# Altium schematic sheet Main scheme.SchDoc
size 410 x 297 mm; ApprovedBy: Стерхов В.Д.; CheckedBy: Стерхов В.Д.; Author: Сергеев Д.А.; CompanyName: ГК "СНАБЖЕНИЕ"; DrawnBy: Сергеев Д.А.; Engineer: Сергеев Д.А.; Organization: ГК "СНАБЖЕНИЕ"; DocumentNumber: ИЛ1397ТО1/1; Revision: ИЛ1397ТО1/1; SheetNumber: 1; SheetTotal: 3
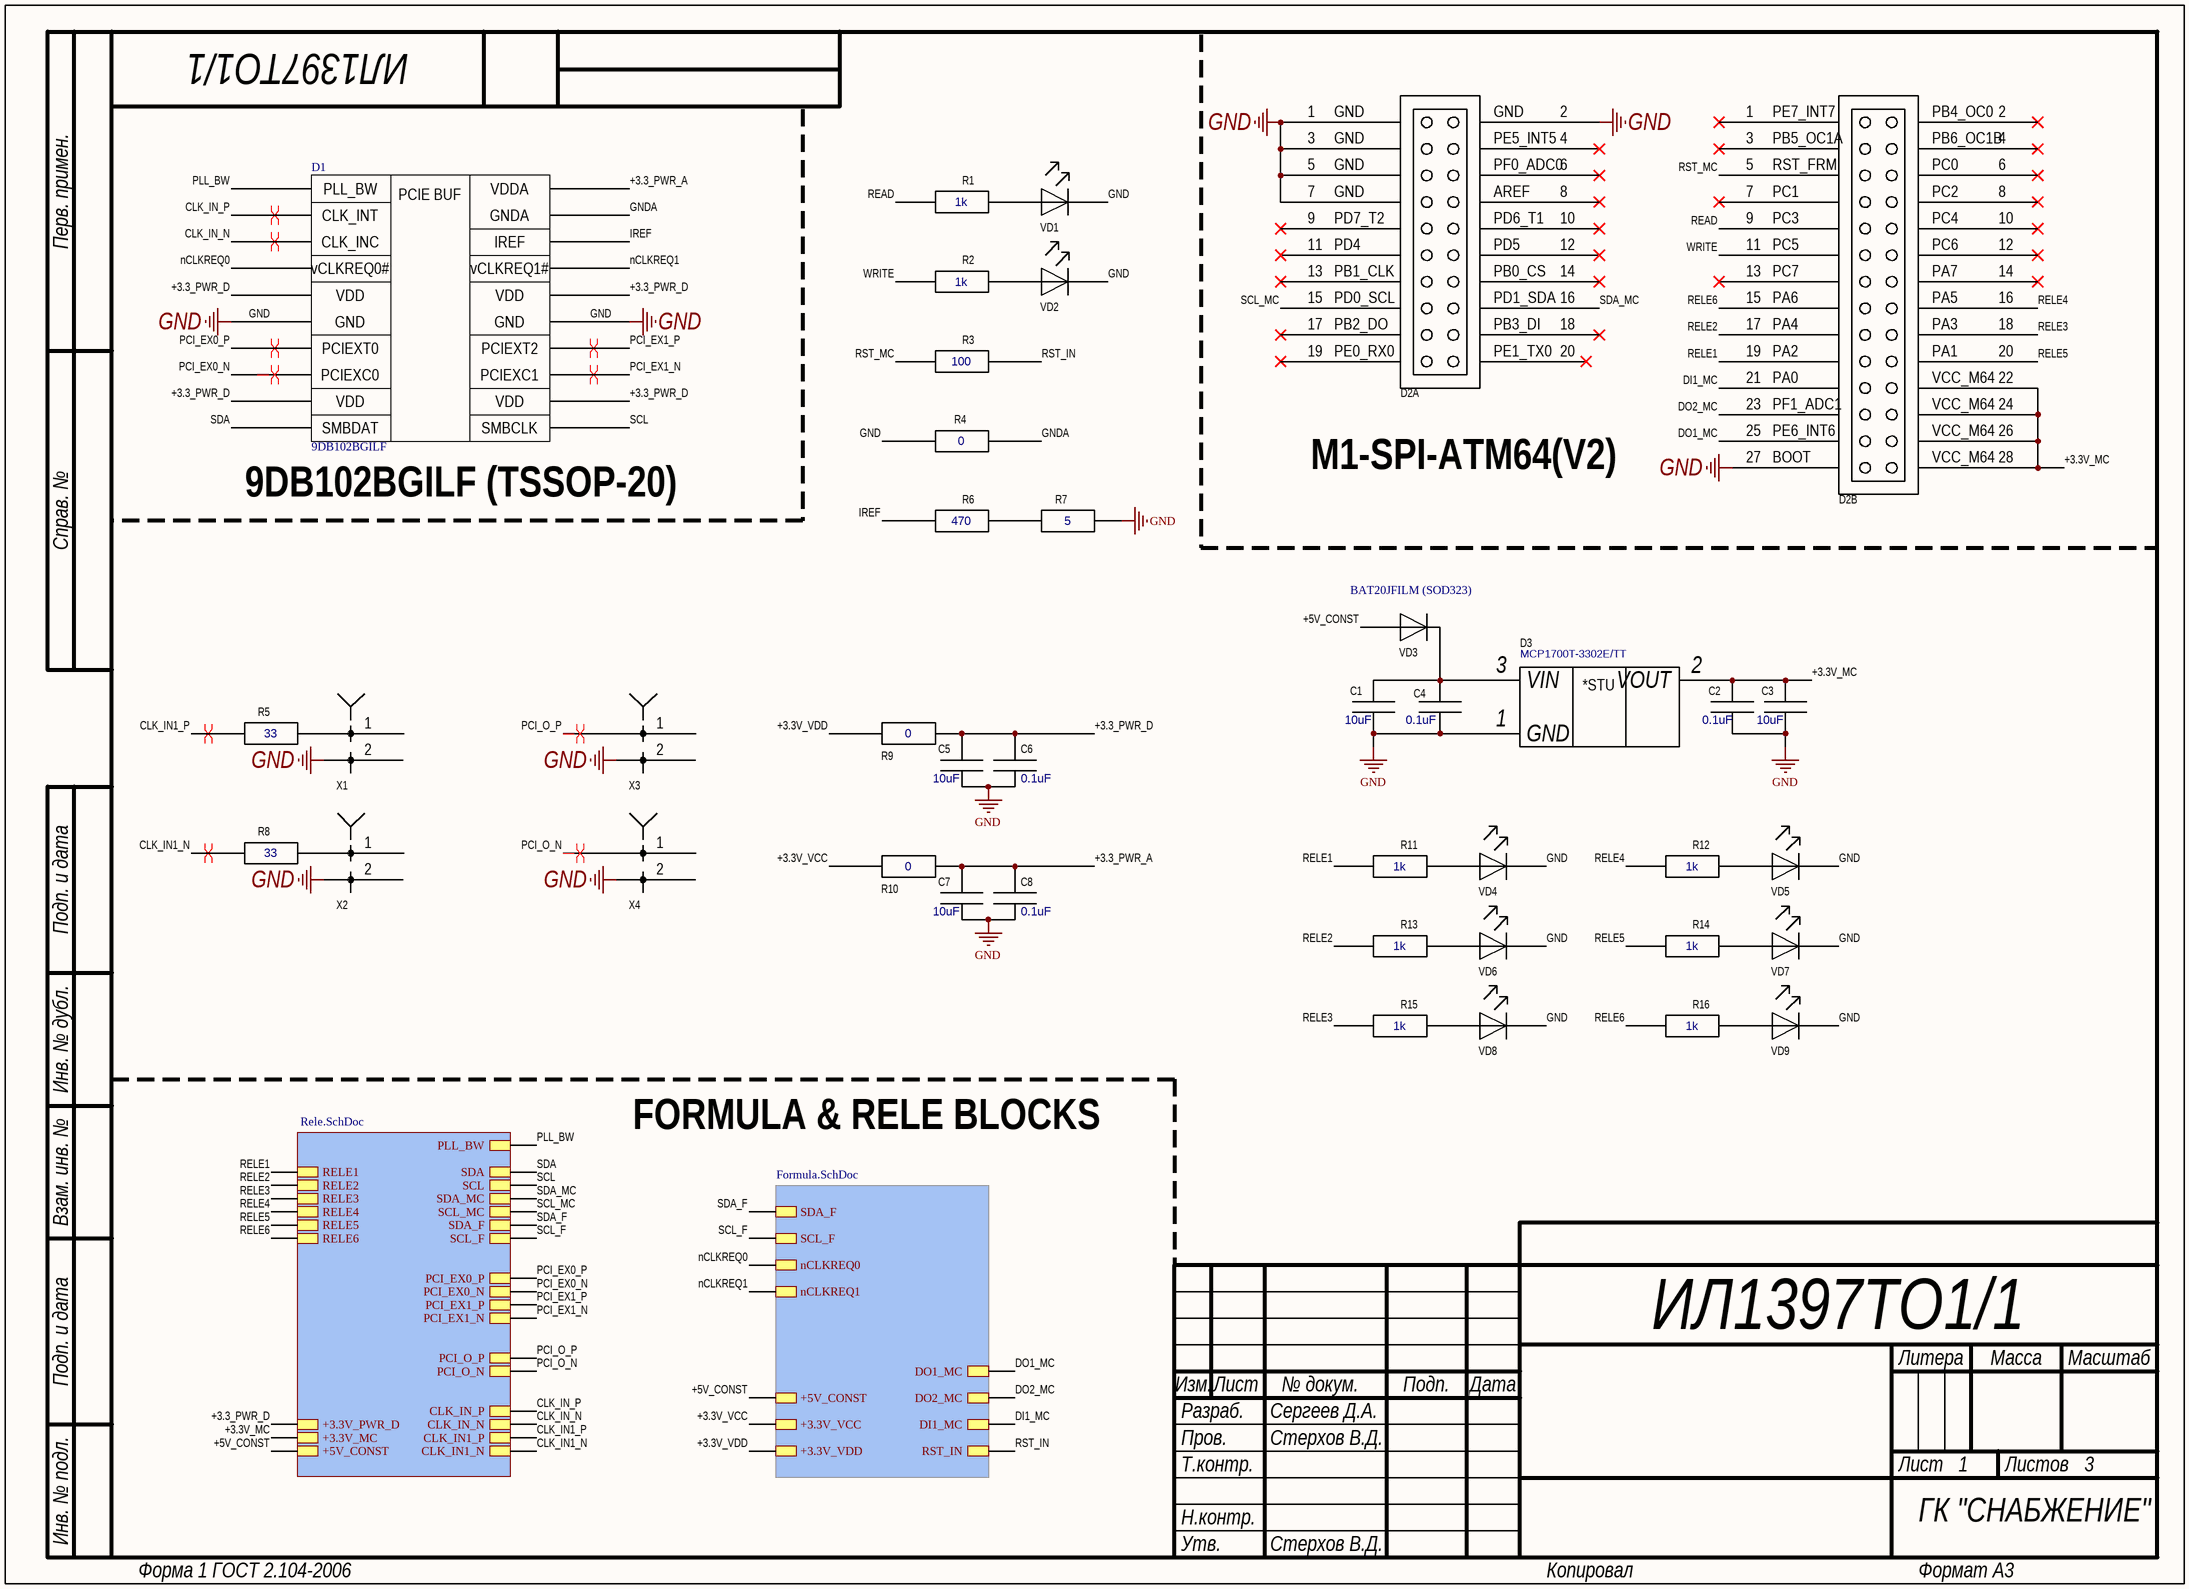
[diagram p0: Main scheme.SchDoc]

## Parts
C1  10uF  [0805]
C2  0.1uF  [0805]
C3  10uF  [0805]
C4  0.1uF  [0805]
C5  10uF  [0805]
C6  0.1uF  [0805]
C7  10uF  [0805]
C8  0.1uF  [0805]
D1  9DB102BGILF  [TSSOP-20 to DIP-20]
D2  M1-SPI-ATM64(V2)  [M1-SPI-ATM64(V2)]  (value not drawn)  (parts A,B of 2)
D3  MCP1700T-3302E/TT  [SOT-23]
R1  1k  [0805]
R2  1k  [0805]
R3  100  [0805]
R4  0  [0805]
R5  33  [0805]
R6  470  [0805]
R7  5  [0805]
R8  33  [0805]
R9  0  [0805]
R10  0  [0805]
R11  1k  [0805]
R12  1k  [0805]
R13  1k  [0805]
R14  1k  [0805]
R15  1k  [0805]
R16  1k  [0805]
VD1  LED(0805)  [0805(LED)]  (value not drawn)
VD2  LED(0805)  [0805(LED)]  (value not drawn)
VD3  BAT20JFILM (SOD323)  [SOD323]
VD4  LED(0805)  [0805(LED)]  (value not drawn)
VD5  LED(0805)  [0805(LED)]  (value not drawn)
VD6  LED(0805)  [0805(LED)]  (value not drawn)
VD7  LED(0805)  [0805(LED)]  (value not drawn)
VD8  LED(0805)  [0805(LED)]  (value not drawn)
VD9  LED(0805)  [0805(LED)]  (value not drawn)
X1  KLS1-SMA002-B  [KLS1-SMA002-B]  (value not drawn)
X2  KLS1-SMA002-B  [KLS1-SMA002-B]  (value not drawn)
X3  KLS1-SMA002-B  [KLS1-SMA002-B]  (value not drawn)
X4  KLS1-SMA002-B  [KLS1-SMA002-B]  (value not drawn)

## Sub-sheets
Formula connector = Formula.SchDoc: +5V_CONST, +3.3V_VCC, +3.3V_VDD, SDA_F, SCL_F, DI1_MC, RST_IN, nCLKREQ0, nCLKREQ1, DO1_MC, DO2_MC
RELE = Rele.SchDoc: SCL_MC, RELE3, PCI_EX1_N, +5V_CONST, PCI_O_N, SCL_F, SDA, RELE1, CLK_IN1_P, CLK_IN1_N, SDA_MC, PCI_O_P, RELE5, SCL, +3.3V_MC, RELE6, RELE2, SDA_F, PCI_EX0_N, CLK_IN_P, +3.3V_PWR_D, PCI_EX0_P, CLK_IN_N, PCI_EX1_P, RELE4, PLL_BW

## Nets
GND: C1.2 C2.2 C3.2 C4.2 C5.2 C6.2 C7.2 C8.2 D1.6 D1.15 D2.1X2 D2.2X2 D2.3X2 D2.5X2 D2.7X2 D2.27X3 D3.1(GND) R4.1 R7.2 VD1.2(K) VD2.2(K) VD4.2(K) VD5.2(K) VD6.2(K) VD7.2(K) VD8.2(K) VD9.2(K) X1.2 X2.2 X3.2 X4.2
+3.3_PWR_A: C7.1 C8.1 D1.20 R10.2
+3.3_PWR_D: C5.1 C6.1 D1.5 D1.9 D1.12 D1.16 R9.2 ; sheet RELE/+3.3V_PWR_D
+3.3V_MC: C2.1 C3.1 D2.22X3 D2.24X3 D2.26X3 D2.28X3 D3.2(VOUT) ; sheet RELE/+3.3V_MC
+3.3V_VCC: R10.1 ; sheet Formula connector/+3.3V_VCC
+3.3V_VDD: R9.1 ; sheet Formula connector/+3.3V_VDD
+5V_CONST: VD3.1(A) ; sheet Formula connector/+5V_CONST, sheet RELE/+5V_CONST
CLK_IN1_N: R8.1 ; sheet RELE/CLK_IN1_N
CLK_IN1_P: R5.1 ; sheet RELE/CLK_IN1_P
CLK_IN_N: D1.3 ; sheet RELE/CLK_IN_N
CLK_IN_P: D1.2 ; sheet RELE/CLK_IN_P
DI1_MC: D2.21X3 ; sheet Formula connector/DI1_MC
DO1_MC: D2.25X3 ; sheet Formula connector/DO1_MC
DO2_MC: D2.23X3 ; sheet Formula connector/DO2_MC
GNDA: D1.19 R4.2
IREF: D1.18 R6.1
nCLKREQ0: D1.4 ; sheet Formula connector/nCLKREQ0
nCLKREQ1: D1.17 ; sheet Formula connector/nCLKREQ1
PCI_EX0_N: D1.8 ; sheet RELE/PCI_EX0_N
PCI_EX0_P: D1.7 ; sheet RELE/PCI_EX0_P
PCI_EX1_N: D1.13 ; sheet RELE/PCI_EX1_N
PCI_EX1_P: D1.14 ; sheet RELE/PCI_EX1_P
PCI_O_N: X4.1 ; sheet RELE/PCI_O_N
PCI_O_P: X3.1 ; sheet RELE/PCI_O_P
PLL_BW: D1.1 ; sheet RELE/PLL_BW
READ: D2.9X3 R1.1
RELE1: D2.19X3 R11.1 ; sheet RELE/RELE1
RELE2: D2.17X3 R13.1 ; sheet RELE/RELE2
RELE3: D2.18X3 R15.1 ; sheet RELE/RELE3
RELE4: D2.16X3 R12.1 ; sheet RELE/RELE4
RELE5: D2.20X3 R14.1 ; sheet RELE/RELE5
RELE6: D2.15X3 R16.1 ; sheet RELE/RELE6
RST_IN: R3.2 ; sheet Formula connector/RST_IN
RST_MC: D2.5X3 R3.1
SCL: D1.11 ; sheet RELE/SCL
SCL_F: sheet Formula connector/SCL_F, sheet RELE/SCL_F
SCL_MC: D2.15X2 ; sheet RELE/SCL_MC
SDA: D1.10 ; sheet RELE/SDA
SDA_F: sheet Formula connector/SDA_F, sheet RELE/SDA_F
SDA_MC: D2.16X2 ; sheet RELE/SDA_MC
WRITE: D2.11X3 R2.1
NetC1_1: C1.1 C4.1 D3.3(VIN) VD3.2(K)
NetR1_2: R1.2 VD1.1(A)
NetR2_2: R2.2 VD2.1(A)
NetR5_2: R5.2 X1.1
NetR6_2: R6.2 R7.1
NetR8_2: R8.2 X2.1
NetR11_2: R11.2 VD4.1(A)
NetR12_2: R12.2 VD5.1(A)
NetR13_2: R13.2 VD6.1(A)
NetR14_2: R14.2 VD7.1(A)
NetR15_2: R15.2 VD8.1(A)
NetR16_2: R16.2 VD9.1(A)

Not connected (* = marked no-connect by the designer): D2 1X3* 2X3* 3X3* 4X2* 4X3* 6X2* 6X3* 7X3* 8X2* 8X3* 9X2* 10X2* 10X3* 11X2* 12X2* 12X3* 13X2* 13X3* 14X2* 14X3* 17X2* 18X2* 19X2* 20X2*

## Layout directives
differential pair: CLK_IN1_N, CLK_IN1_P, CLK_IN_N, CLK_IN_P, PCI_EX0_N, PCI_EX0_P, PCI_EX1_N, PCI_EX1_P, PCI_O_N, PCI_O_P

## Notes on the sheet
- M1-SPI-ATM64(V2)
- (near D1) 9DB102BGILF (TSSOP-20)
- FORMULA & RELE BLOCKS
- Перв. примен.
- Справ. №
- Подп. и дата
- Инв. № дубл.
- Взам. инв. №
- Разраб.
- Изм.
- Лист
- № докум.
- Подп.
- Дата
- Литера
- Масса
- Масштаб
- Пров.
- Т.контр.
- Листов
- Инв. № подл.
- Н.контр.
- Утв.
- Форма 1 ГОСТ 2.104-2006
- Копировал
- Формат А3
- (in symbol 9DB102BGILF) PLL_BW; VDDA; PCIE BUF; CLK_INT; GNDA; CLK_INC; IREF; vCLKREQ0#; vCLKREQ1#; VDD; GND; PCIEXT0; PCIEXT2; PCIEXC0; PCIEXC1; SMBDAT; SMBCLK
- (in symbol M1-SPI-ATM64(V2), part A) GND; 3; PE5_INT5; 4; 5; PF0_ADC0; 6; 7; AREF; 8; 9; PD7_T2; PD6_T1; 10; 11; PD4; PD5; 12; 13; PB1_CLK; PB0_CS; 14; 15; PD0_SCL; PD1_SDA; 16; 17; PB2_DO; PB3_DI; 18; 19; PE0_RX0; PE1_TX0; 20
- (in symbol M1-SPI-ATM64(V2), part B) PE7_INT7; PB4_OC0; 3; PB5_OC1A; PB6_OC1B; 4; 5; RST_FRM; PC0; 6; 7; PC1; PC2; 8; 9; PC3; PC4; 10; 11; PC5; PC6; 12; 13; PC7; PA7; 14; 15; PA6; PA5; 16; 17; PA4; PA3; 18; 19; PA2; PA1; 20; 21; PA0; VCC_M64; 22; 23; PF1_ADC1; 24; 25; PE6_INT6; 26; 27; BOOT; 28
- (in symbol MCP1700T-3302E/TT) *STU

## Library data of the parts
C1-C8 = C0805: ComponentHeigt: 1.3; Firme: AVX; Leadform: SMD; KIND: Конденсатор; ClassName: *; Component Link: *; ComponentWeigt: *; Packaging: 0805; NN: *; Value: *
D2 = M1-SPI-ATM64(V2): ComponentHeigt: 5.5; Name: Вилка; Specification: Вилка PLD2-2 *; Typ: PLD2-2; ClassName: *; Component Link: *; ComponentWeigt: *; Firme: *; Leadform: *; NN: *; KIND: *
D3 = MCP1700T-3302E/TT: ComponentHeigt: 1.8; Firme: Linear; Leadform: формована; Kind: Микросхема; ClassName: *; Component Link: *; Packaging: SOT-223; NN: *
R1-R5 R8-R16 = R0805 Yageo: ComponentHeigt: 0.6; Firme: Yageo; Leadform: SMD; Kind: Резистор; ClassName: *; ComponentWeigt: *; Component Link: *; Packaging: 0805; NN: *; Value: *
R6 R7 = R0805 Yageo: 1%; ComponentHeigt: 0.6; Firme: Yageo; Leadform: SMD; Kind: Резистор; ClassName: *; ComponentWeigt: *; Component Link: *; Packaging: 0805; NN: *; Value: *
VD1 VD2 VD4-VD9 = LED(0805): ComponentHeigt: 0.75; Leadform: в отверстия; Firme: Kingbright; NN: 24003000; KIND: Светодиод L-1154GD Kingbright; Component Link: *; ClassName: *
VD3 = BAT20JFILM (SOD323): ComponentHeigt: 0.75; Leadform: в отверстия; Firme: Kingbright; NN: 24003000; KIND: Светодиод L-1154GD Kingbright; Component Link: *; ClassName: *
X1-X4 = KLS1-SMA002-B: ComponentHeigt: 5.5; Name: Вилка; Specification: Вилка PLD2-2 *; Typ: PLD2-2; ClassName: *; Component Link: *; ComponentWeigt: *; Firme: *; Leadform: *; NN: *; KIND: *